# Altium schematic sheet DumbWatch.SchDoc
size A4; SheetNumber: 1; SheetTotal: 1
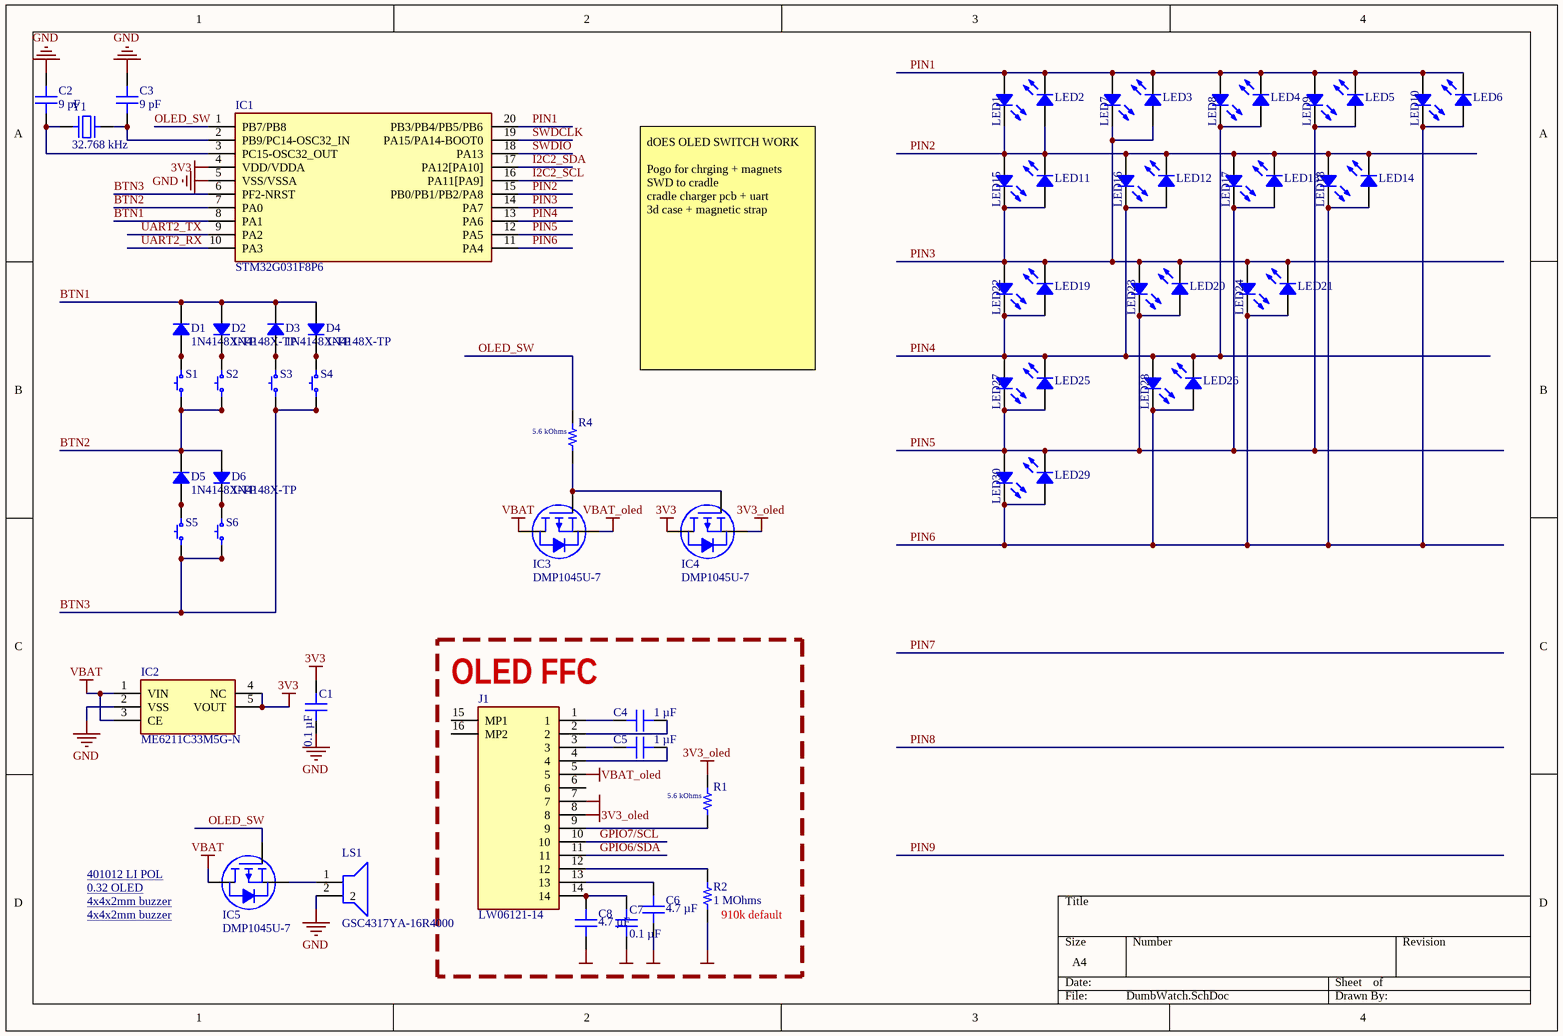
[diagram p0: DumbWatch.SchDoc]

## Parts
C1  0.1 µF  [CAP 0402_1005]
C2  9 pF  [CAP 0402_1005]
C3  9 pF  [CAP 0402_1005]
C4  1 µF  [CAP 0402_1005]
C5  1 µF  [CAP 0402_1005]
C6  4.7 µF  [CAP 0603_1608]
C7  0.1 µF  [CAP 0402_1005]
C8  4.7 µF  [CAP 0603_1608]
D1  1N4148X-TP  [SOD-523]
D2  1N4148X-TP  [SOD-523]
D3  1N4148X-TP  [SOD-523]
D4  1N4148X-TP  [SOD-523]
D5  1N4148X-TP  [SOD-523]
D6  1N4148X-TP  [SOD-523]
IC1  STM32G031F8P6  [CLT34BT6]
IC2  ME6211C33M5G-N  [SOT95P270X145-5N]
IC3  DMP1045U-7  [DIODES SOT-23-3]
IC4  DMP1045U-7  [DIODES SOT-23-3]
IC5  DMP1045U-7  [DIODES SOT-23-3]
J1  LW06121-14  [LW0612114]
LED1  Yellow  [LED 0603_1608 YELLOW]  (value not drawn)
LED2  Yellow  [LED 0603_1608 YELLOW]  (value not drawn)
LED3  Yellow  [LED 0603_1608 YELLOW]  (value not drawn)
LED4  Yellow  [LED 0603_1608 YELLOW]  (value not drawn)
LED5  Yellow  [LED 0603_1608 YELLOW]  (value not drawn)
LED6  Yellow  [LED 0603_1608 YELLOW]  (value not drawn)
LED7  Yellow  [LED 0603_1608 YELLOW]  (value not drawn)
LED8  Yellow  [LED 0603_1608 YELLOW]  (value not drawn)
LED9  Yellow  [LED 0603_1608 YELLOW]  (value not drawn)
LED10  Yellow  [LED 0603_1608 YELLOW]  (value not drawn)
LED11  Yellow  [LED 0603_1608 YELLOW]  (value not drawn)
LED12  Yellow  [LED 0603_1608 YELLOW]  (value not drawn)
LED13  Yellow  [LED 0603_1608 YELLOW]  (value not drawn)
LED14  Yellow  [LED 0603_1608 YELLOW]  (value not drawn)
LED15  Yellow  [LED 0603_1608 YELLOW]  (value not drawn)
LED16  Yellow  [LED 0603_1608 YELLOW]  (value not drawn)
LED17  Yellow  [LED 0603_1608 YELLOW]  (value not drawn)
LED18  Yellow  [LED 0603_1608 YELLOW]  (value not drawn)
LED19  Yellow  [LED 0603_1608 YELLOW]  (value not drawn)
LED20  Yellow  [LED 0603_1608 YELLOW]  (value not drawn)
LED21  Yellow  [LED 0603_1608 YELLOW]  (value not drawn)
LED22  Yellow  [LED 0603_1608 YELLOW]  (value not drawn)
LED23  Yellow  [LED 0603_1608 YELLOW]  (value not drawn)
LED24  Yellow  [LED 0603_1608 YELLOW]  (value not drawn)
LED25  Yellow  [LED 0603_1608 YELLOW]  (value not drawn)
LED26  Yellow  [LED 0603_1608 YELLOW]  (value not drawn)
LED27  Yellow  [LED 0603_1608 YELLOW]  (value not drawn)
LED28  Yellow  [LED 0603_1608 YELLOW]  (value not drawn)
LED29  Yellow  [LED 0603_1608 YELLOW]  (value not drawn)
LED30  Yellow  [LED 0603_1608 YELLOW]  (value not drawn)
LS1  GSC4317YA-16R4000  [GSC4317YA16R4000]
R1  5.6 kOhms  [RES 0402_1005]
R2  1 MOhms  [RES 0603_1608]
R4  5.6 kOhms  [RES 0402_1005]
S1  KMR741NG ULC LFS  [C&K KMR7]  (value not drawn)
S2  KMR741NG ULC LFS  [C&K KMR7]  (value not drawn)
S3  KMR741NG ULC LFS  [C&K KMR7]  (value not drawn)
S4  KMR741NG ULC LFS  [C&K KMR7]  (value not drawn)
S5  KMR741NG ULC LFS  [C&K KMR7]  (value not drawn)
S6  KMR741NG ULC LFS  [C&K KMR7]  (value not drawn)
Y1  32.768 kHz  [ABRACON ABS06]

## Blocks framed on the sheet
OLED FFC: C4-C8 J1 R1 R2

## Nets
3V3: C1.2 IC1.4(VDD/VDDA) IC2.4(NC) IC2.5(VOUT) IC4.3(D)
3V3_oled: IC4.2(S) J1.8 R1.1
GND: C1.1 C2.2 C3.2 C6.1 C7.1 C8.1 IC1.5(VSS/VSSA) IC2.2(VSS) J1.7 LS1.2 R2.1
VBAT: IC2.1(VIN) IC2.3(CE) IC3.3(D) IC5.3(D)
VBAT_oled: IC3.2(S) J1.5
BTN1: D1.2 D2.1 D3.2 D4.1 IC1.8(PA1)
BTN2: D5.2 D6.1 IC1.7(PA0) S1.1 S1.2 S2.1 S2.2
BTN3: IC1.6(PF2-NRST) S3.1 S3.2 S4.1 S4.2 S5.1 S5.2 S6.1 S6.2
GPIO6/SDA: J1.11
GPIO7/SCL: J1.10
I2C2_SCL: IC1.16(PA11[PA9])
I2C2_SDA: IC1.17(PA12[PA10])
OLED_SW: IC1.1(PB7/PB8) IC5.1(G) R4.1
PIN1: IC1.20(PB3/PB4/PB5/PB6) LED1.1 LED2.2 LED3.2 LED4.2 LED5.2 LED6.2 LED7.1 LED8.1 LED9.1 LED10.1
PIN2: IC1.15(PB0/PB1/PB2/PA8) LED1.2 LED2.1 LED11.2 LED12.2 LED13.2 LED14.2 LED15.1 LED16.1 LED17.1 LED18.1
PIN3: IC1.14(PA7) LED3.1 LED7.2 LED11.1 LED15.2 LED19.2 LED20.2 LED21.2 LED22.1 LED23.1 LED24.1
PIN4: IC1.13(PA6) LED4.1 LED8.2 LED12.1 LED16.2 LED19.1 LED22.2 LED25.2 LED26.2 LED27.1 LED28.1
PIN5: IC1.12(PA5) LED5.1 LED9.2 LED13.1 LED17.2 LED20.1 LED23.2 LED25.1 LED27.2 LED29.2 LED30.1
PIN6: IC1.11(PA4) LED6.1 LED10.2 LED14.1 LED18.2 LED21.1 LED24.2 LED26.1 LED28.2 LED29.1 LED30.2
SWDCLK: IC1.19(PA15/PA14-BOOT0)
SWDIO: IC1.18(PA13)
UART2_RX: IC1.10(PA3)
UART2_TX: IC1.9(PA2)
NetC2_1: C2.1 IC1.3(PC15-OSC32_OUT) Y1.2
NetC3_1: C3.1 IC1.2(PB9/PC14-OSC32_IN) Y1.1
NetC4_1: C4.1 J1.2
NetC4_2: C4.2 J1.1
NetC5_1: C5.1 J1.4
NetC5_2: C5.2 J1.3
NetC6_2: C6.2 J1.13
NetC7_2: C7.2 C8.2 J1.14
NetD1_1: D1.1 S1.3 S1.4
NetD2_2: D2.2 S2.3 S2.4
NetD3_1: D3.1 S3.3 S3.4
NetD4_2: D4.2 S4.3 S4.4
NetD5_1: D5.1 S5.3 S5.4
NetD6_2: D6.2 S6.3 S6.4
NetIC3_1: IC3.1(G) IC4.1(G) R4.2
NetIC5_2: IC5.2(S) LS1.1
NetJ1_9: J1.9 R1.2
NetJ1_12: J1.12 R2.2

Not connected (* = marked no-connect by the designer): J1 6 15(MP1) 16(MP2)

## Notes on the sheet
- dOES OLED SWITCH WORK
  Pogo for chrging + magnets
  SWD to cradle
  cradle charger pcb + uart
  3d case + magnetic strap
- 401012 LI POL <https://market.yandex.ru/card/akkumulyatornaya-batareya-universalnaya-401012p-37v-li-pol-50-mah-41012-mm-dlya-tws-naushnikov/103249508648?do-waremd5=prv-sXhJ6hImsOcWyh8X2g&clid=1651&ysclid=mumixn4w2285297939>
- 0.32 OLED <https://www.buydisplay.com/i2c-white-0-32-inch-oled-display-panel-60x32-pixels>
- 4x4x2mm buzzer <https://aliexpress.ru/item/1005003125975556.html?spm=a2g2w.detail.rcmdprod.7.1a123493I81UYp&mixer_rcmd_bucket_id=testRankingSimilarNoChoiceBoost&pdp_trigger_item_id=0_1005009193886460&ru_algo_pv_id=61bca3-61b690-48724f-c0d4e5-1791028800&scenario=aerSimilarItemPdpRcmd&shpMethod=CAINIAO_SUPER_ECONOMY&sku_id=12000048179159758&traffic_source=recommendation&type_rcmd=core>
- 4x4x2mm buzzer <https://jlcpcb.com/partdetail/1056291-Cy_SMD_40203040/C968744?utm_source=chatgpt.com>
- (near R2) 910k default

## Library data of the parts
C1 C7 = C0402C104M3PAC7867: CAP CER 0.1UF 25V X5R 0402; manufacturer: KEMET; Tolerance: ±20%; Part Number: C0402C104M3PAC7867; value: 0.1 µF; Applications: Bypass, Decoupling; Capacitance: 0.1 µF; componentlink1description: Datasheet; componentlink1url: https://api.kemet.com/component-edge/download/datasheet/C0402C104M3PAC7867.pdf; componentlink2description: DigiKey Link; componentlink2url: https://www.digikey.com/en/products/detail/kemet/C0402C104M3PAC7867/7390685; Device Package: 0402 (1005 Metric); lastupdated: 4/6/2026 7:11:09 PM; Lifecycle Status: Active; Minimum Order: 1; Mounting Type: Surface Mount, MLCC; Operating Temperature: -55°C ~ 85°C; Package / Case: 0402 (1005 Metric); packaging: TapeAndReel; partid: 2096; Part Status: Active; price: 0.01; series: SMD Comm X5R; Size / Dimension: 0.039" L x 0.020" W (1.00mm x 0.50mm); Supplier 1: DigiKey; Supplier Part Number 1: 399-15637-1-ND; Temperature Coefficient: X5R; Thickness (Max): 0.022" (0.55mm); Voltage - Rated: 25V
C2 C3 = GCQ1555C1H9R0BB01D: CAP CER 9PF 50V C0G/NP0 0402; manufacturer: Murata Electronics; Temperature Coefficient: C0G, NP0; Tolerance: ±0.1pF; Part Number: GCQ1555C1H9R0BB01D; value: 9 pF; Applications: RF, Microwave, High Frequency, Automotive; Capacitance: 9 pF; componentlink1description: Datasheet; componentlink1url: https://search.murata.co.jp/Ceramy/image/img/A01X/G101/ENG/GCQ1555C1H9R0BB01-01.pdf; componentlink2description: DigiKey Link; componentlink2url: https://www.digikey.com/en/products/detail/murata-electronics/GCQ1555C1H9R0BB01D/7803116; Device Package: 0402 (1005 Metric); lastupdated: 4/6/2026 7:10:26 PM; Lifecycle Status: Active; Minimum Order: 1; Mounting Type: Surface Mount, MLCC; Operating Temperature: -55°C ~ 125°C; Package / Case: 0402 (1005 Metric); packaging: TapeAndReel; partid: 12256; Part Status: Active; price: 0.04; series: GCQ; Size / Dimension: 0.039" L x 0.020" W (1.00mm x 0.50mm); Supplier 1: DigiKey; Supplier Part Number 1: 490-17523-1-ND; Thickness (Max): 0.022" (0.55mm); Voltage - Rated: 50V; Ratings: AEC-Q200
C4 C5 = GMC04X5R105K25NT: CAP0402 X5R 1UF 10% 25V; manufacturer: Cal-Chip Electronics, Inc.; Part Number: GMC04X5R105K25NT; value: 1 µF; Applications: General Purpose; Capacitance: 1 µF; componentlink1description: Datasheet; componentlink1url: https://calchip.com/wp-content/uploads/2023/09/GMC-Series-2.pdf; componentlink2description: DigiKey Link; componentlink2url: https://www.digikey.com/en/products/detail/cal-chip-electronics-inc/GMC04X5R105K25NT/23571683; Device Package: 0402 (1005 Metric); lastupdated: 4/6/2026 7:07:11 PM; Lifecycle Status: Active; Minimum Order: 1; Mounting Type: Surface Mount, MLCC; Operating Temperature: -55°C ~ 85°C; Package / Case: 0402 (1005 Metric); packaging: TapeAndReel; partid: 62676; price: 0.01; series: GMC; Size / Dimension: 0.039" L x 0.020" W (1.00mm x 0.50mm); Supplier 1: DigiKey; Supplier Part Number 1: 4713-GMC04X5R105K25NTCT-ND; Temperature Coefficient: X5R; Thickness (Max): 0.022" (0.55mm); Tolerance: ±10%; Voltage - Rated: 25V
C6 C8 = CL10A475KA8NQNC: CAP CER 4.7UF 25V X5R 0603; manufacturer: Samsung Electro-Mechanics; Tolerance: ±10%; Part Number: CL10A475KA8NQNC; Capacitance: 4.7 µF; Applications: General Purpose; componentlink1description: Datasheet; componentlink1url: http://www.samsungsem.com/kr/support/product-search/mlcc/CL10A475KA8NQNC.jsp; componentlink2description: DigiKey Link; componentlink2url: https://www.digikey.com/en/products/detail/samsung-electro-mechanics/CL10A475KA8NQNC/3887558; Device Package: 0603 (1608 Metric); lastupdated: 4/6/2026 7:23:52 PM; Lifecycle Status: Active; Minimum Order: 1; Mounting Type: Surface Mount, MLCC; Operating Temperature: -55°C ~ 85°C; Package / Case: 0603 (1608 Metric); packaging: TapeAndReel; partid: 2349; Part Status: Active; price: 0.06; series: CL; Size / Dimension: 0.063" L x 0.031" W (1.60mm x 0.80mm); Supplier 1: DigiKey; Supplier Part Number 1: 1276-1900-1-ND; Temperature Coefficient: X5R; Thickness (Max): 0.035" (0.90mm); value: 4.7 µF; Voltage - Rated: 25V
D1-D6 = 1N4148X-TP: DIODE GEN PURP 75V 150MA SOD523; Manufacturer: Micro Commercial Co; Capacitance @ Vr, F: 2pF @ 0V, 1MHz; Current - Reverse Leakage @ Vr: 1 µA @ 75 V; Diode Type: Standard; Reverse Recovery Time (trr): 4 ns; Speed: Small Signal =< 200mA (Io), Any Speed; Voltage - Forward (Vf) (Max) @ If: 1.25 V @ 150 mA; Part Number: 1N4148X-TP; ComponentLink1Description: Datasheet; ComponentLink1URL: https://www.mccsemi.com/pdf/Products/1N4148X(SOD-523).PDF; ComponentLink2Description: DigiKey Link; ComponentLink2URL: https://www.digikey.com/en/products/detail/micro-commercial-co/1N4148X-TP/789328; Current - Average Rectified (Io): 150mA; LastUpdated: 4/5/2026 8:44:43 PM; Lifecycle Status: Active; Minimum Order: 1; Mounting Type: Surface Mount; Operating Temperature - Junction: -65°C ~ 150°C; Package / Case: SC-79, SOD-523; Packaging: TapeAndReel; PartId: 2733; Part Status: Active; Price: 0.02; Series: -; Supplier 1: DigiKey; Supplier Part Number 1: 1N4148XTPMSCT-ND; Supplier Device Package: SOD-523; Voltage - DC Reverse (Vr) (Max): 75 V
IC1 = STM32G031F8P6: Integrated Circuit; Manufacturer_Name: STMicroelectronics; Datasheet Link: https://www.st.com/resource/en/datasheet/stm32g031c6.pdf; Height: 1.2mm; Manufacturer_Part_Number: STM32G031F8P6; Mouser Part Number: 511-STM32G031F8P6; Mouser Price/Stock: https://www.mouser.co.uk/ProductDetail/STMicroelectronics/STM32G031F8P6?qs=uwxL4vQweFPCanBqg1D5fQ%3D%3D; Arrow Part Number: STM32G031F8P6; Arrow Price/Stock: https://www.arrow.com/en/products/stm32g031f8p6/stmicroelectronics.html?utm_currency=USD&region=asia
IC2 = ME6211C33M5G-N: Integrated Circuit; Manufacturer_Name: Microne; Datasheet Link: https://datasheet.lcsc.com/szlcsc/1811131510_MICRONE-Nanjing-Micro-One-Elec-ME6211C33M5G-N_C82942.pdf; Height: 1.45mm; Manufacturer_Part_Number: ME6211C33M5G-N
IC3-IC5 = DMP1045U-7: MOSFET P-CH 12V 4A SOT23; Manufacturer: Diodes Incorporated; Current - Continuous Drain (Id) @ 25°C: 4A (Ta); Drive Voltage (Max Rds On,  Min Rds On): 1.8V, 4.5V; FET Type: P-Channel; Gate Charge (Qg) (Max) @ Vgs: 15.8 nC @ 4.5 V; Input Capacitance (Ciss) (Max) @ Vds: 1357 pF @ 10 V; Power Dissipation (Max): 800mW (Ta); Rds On (Max) @ Id, Vgs: 31mOhm @ 4A, 4.5V; Vgs (Max): ±8V; Vgs(th) (Max) @ Id: 1V @ 250µA; Part Number: DMP1045U-7; ComponentLink1Description: Datasheet; ComponentLink1URL: https://www.diodes.com/assets/Datasheets/DMP1045U.pdf; ComponentLink2Description: DigiKey Link; ComponentLink2URL: https://www.digikey.com/en/products/detail/diodes-incorporated/DMP1045U-7/4249936; Drain to Source Voltage (Vdss): 12 V; LastUpdated: 2/8/2024 9:46:13 PM; Lifecycle Status: Active; Minimum Order: 1; Mounting Type: Surface Mount; Operating Temperature: -55°C ~ 150°C (TJ); Package / Case: TO-236-3, SC-59, SOT-23-3; Packaging: TapeAndReel; Part Status: Active; Price: 0.07; Series: -; Supplier 1: DigiKey; Supplier Part Number 1: DMP1045U-7DICT-ND; Supplier Device Package: SOT-23-3; Technology: MOSFET (Metal Oxide)
J1 = LW06121-14: Connector; Manufacturer_Name: ZGW; Datasheet Link: https://img.alicdn.com/imgextra/i2/2207920701525/O1CN01NvA4no1N8UsK9FWcH_!!2207920701525.jpg; Height: 1.35mm; Manufacturer_Part_Number: LW06121-14
LED1-LED30 = QBLP601-Y5-2897: 0603 LED YELLOW 590NM, CLEAR LEN; Manufacturer: QT Brightek (QTB); Configuration: Standard; Current - Test: 5mA; Lens Color: Colorless; Lens Size: 1.10mm x 0.80mm; Lens Style: Rectangle with Flat Top; Millicandela Rating: 104mcd; Viewing Angle: 140°; Voltage - Forward (Vf) (Typ): 1.9V; Wavelength - Peak: 592nm; Part Number: QBLP601-Y5-2897; Color: Yellow; ComponentLink1Description: Datasheet; ComponentLink1URL: https://www.qt-brightek.com/datasheet/QBLP601-Y5-2897.pdf; ComponentLink2Description: DigiKey Link; ComponentLink2URL: https://www.digikey.com/en/products/detail/qt-brightek-qtb/QBLP601-Y5-2897/22106639; Device Package: 0603 (1608 Metric); Height (Max): 0.70mm; LastUpdated: 4/5/2026 8:39:54 PM; Lens Transparency: Clear; Lifecycle Status: Active; Minimum Order: 1; Mounting Type: Surface Mount; Package / Case: 0603 (1608 Metric); Packaging: TapeAndReel; PartId: 1491; Price: 0.06; Series: QBLP601; Size / Dimension: 1.60mm L x 0.80mm W; Supplier 1: DigiKey; Supplier Part Number 1: 1516-QBLP601-Y5-2897CT-ND; Supplier Device Package: 0603; Value: Yellow; Wavelength - Dominant: 590nm
LS1 = GSC4317YA-16R4000: Loudspeaker or Buzzer; Manufacturer_Name: INGHAi; Datasheet Link: https://datasheet.lcsc.com/szlcsc/1810191428_INGHAi-GSC4317YA-16R4000_C255307.pdf; Height: 2mm; Manufacturer_Part_Number: GSC4317YA-16R4000
R1 R4 = CR0402-FX-5601GLF: RES SMD 5.6K OHM 1% 1/16W 0402; Manufacturer: Bourns Inc.; Power (Watts): 0.063W, 1/16W; Temperature Coefficient: ±100ppm/°C; Part Number: CR0402-FX-5601GLF; Value: 5.6 kOhms; ComponentLink1Description: Datasheet; ComponentLink1URL: https://www.bourns.com/docs/Product-Datasheets/CR0402.pdf; ComponentLink2Description: DigiKey Link; ComponentLink2URL: https://www.digikey.com/en/products/detail/bourns-inc/CR0402-FX-5601GLF/3783426; Composition: Thick Film; Device Package: 0402 (1005 Metric); Height - Seated (Max): 0.016" (0.40mm); LastUpdated: 2/9/2024 8:30:06 PM; Lifecycle Status: Active; Minimum Order: 1; Number of Terminations: 2; Operating Temperature: -55°C ~ 155°C; Package / Case: 0402 (1005 Metric); Packaging: CutTape; PartId: 6632; Price: 0.01; Resistance: 5.6 kOhms; Series: CR0402; Size / Dimension: 0.039" L x 0.020" W (1.00mm x 0.50mm); Supplier 1: DigiKey; Supplier Part Number 1: CR0402-FX-5601GLFCT-ND; Supplier Device Package: 0402; Tolerance: ±1%; Part Status: Active
R2 = ERJ-3EKF1004V: RES SMD 1M OHM 1% 1/10W 0603; Manufacturer: Panasonic Electronic Components; Power (Watts): 0.1W, 1/10W; Temperature Coefficient: ±100ppm/°C; Part Number: ERJ-3EKF1004V; Value: 1 MOhms; ComponentLink1Description: Datasheet; ComponentLink1URL: https://industrial.panasonic.com/cdbs/www-data/pdf/RDA0000/AOA0000C304.pdf; ComponentLink2Description: DigiKey Link; ComponentLink2URL: https://www.digikey.com/en/products/detail/panasonic-electronic-components/ERJ-3EKF1004V/196033; Composition: Thick Film; Device Package: 0603 (1608 Metric); Height - Seated (Max): 0.022" (0.55mm); LastUpdated: 2/9/2024 8:42:00 PM; Lifecycle Status: Active; Minimum Order: 1; Number of Terminations: 2; Operating Temperature: -55°C ~ 155°C; Package / Case: 0603 (1608 Metric); Packaging: TapeAndReel; PartId: 25691; Part Status: Active; Price: 0.01; Resistance: 1 MOhms; Series: ERJ-3EK; Size / Dimension: 0.063" L x 0.031" W (1.60mm x 0.80mm); Supplier 1: DigiKey; Supplier Part Number 1: P1.00MHCT-ND; Supplier Device Package: 0603; Tolerance: ±1%; Features: Automotive AEC-Q200; Ratings: AEC-Q200
S1-S6 = KMR741NG ULC LFS: SWITCH TACTILE SPST-NO 50MA 32V; Manufacturer: C&K; Actuator Height off PCB, Vertical: 2.50mm; Actuator Orientation: Top Actuated; Actuator Type: Standard; Contact Rating @ Voltage: 0.05A @ 32VDC; Illumination: Non-Illuminated; Ingress Protection: IP67 - Dust Tight, Waterproof; Operating Force: 400gf; Outline: 4.20mm x 2.80mm; Switch Function: Off-Mom; Part Number: KMR741NG ULC LFS; Circuit: SPST-NO; ComponentLink1Description: Datasheet; ComponentLink1URL: https://dznh3ojzb2azq.cloudfront.net/products/Tactile/KMR7/documents/datasheet.pdf; ComponentLink2Description: DigiKey Link; ComponentLink2URL: http://digikey.com/product-detail/en/c-k/KMR741NG-ULC-LFS/CKN10688CT-ND/6035360; LastUpdated: 4/9/2020 10:01:05 AM; Lifecycle Status: Active; Minimum Order: 1; Mounting Type: Surface Mount; Operating Temperature: -40°C ~ 85°C; Packaging: TapeAndReel; Part Status: Active; Price: 0.16; Series: KMR7; Supplier 1: DigiKey; Supplier Part Number 1: CKN10688CT-ND; Termination Style: Gull Wing
Y1 = ABS06-32.768KHZ-9-1-T: CRYSTAL 32.7680KHZ 9PF SMD; Manufacturer: Abracon LLC; ESR (Equivalent Series Resistance): 90 kOhms; Frequency Tolerance: ±10ppm; Operating Mode: Fundamental; Part Number: ABS06-32.768KHZ-9-1-T; ComponentLink1Description: Datasheet; ComponentLink1URL: https://abracon.com/Resonators/ABS06.pdf; ComponentLink2Description: DigiKey Link; ComponentLink2URL: https://www.digikey.com/en/products/detail/abracon-llc/ABS06-32-768KHZ-9-1-T/2217993; Frequency: 32.768 kHz; Height - Seated (Max): 0.024" (0.60mm); LastUpdated: 4/5/2026 8:41:05 PM; Lifecycle Status: Active; Load Capacitance: 9pF; Minimum Order: 1; Mounting Type: Surface Mount; Operating Temperature: -40°C ~ 85°C; Package / Case: 2-SMD, No Lead; Packaging: TapeAndReel; PartId: 371; Part Status: Active; Price: 0.49; Series: ABS06; Size / Dimension: 0.079" L x 0.047" W (2.00mm x 1.20mm); Supplier 1: DigiKey; Supplier Part Number 1: 535-10247-1-ND; Type: kHz Crystal (Tuning Fork); Value: 32.768 kHz